# Altium schematic sheet 26_Radar_PMIC_and_rail_filters.SchDoc
size 289 x 400 mm
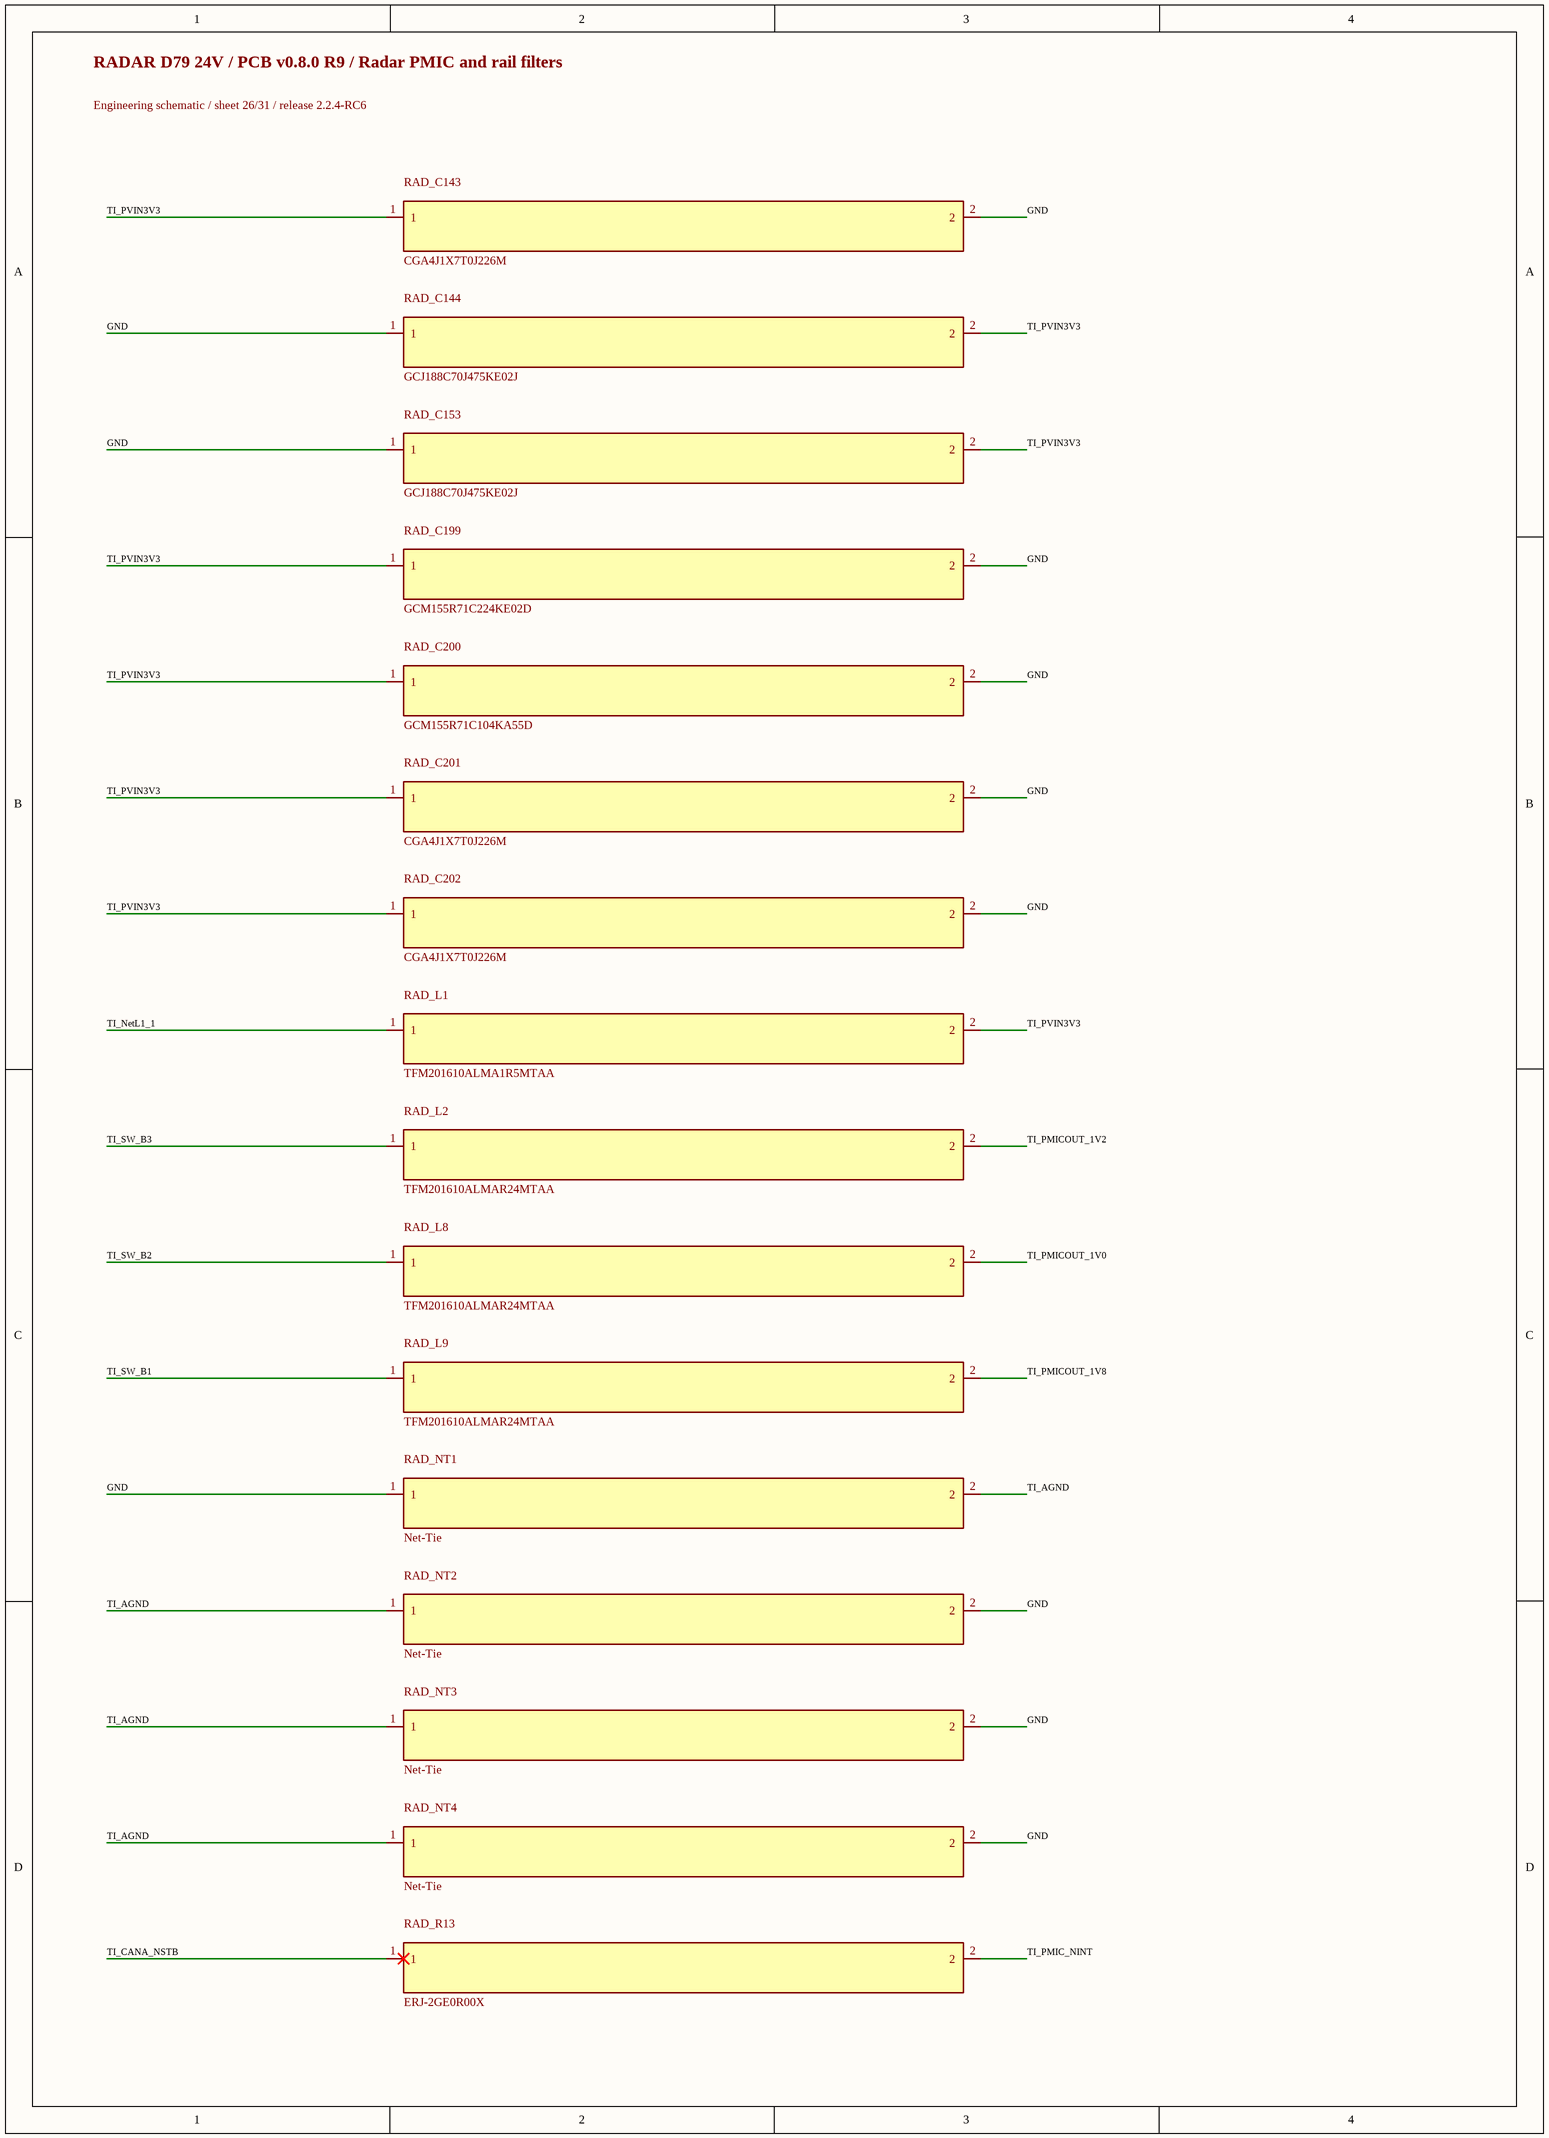
[diagram p0: 26_Radar_PMIC_and_rail_filters.SchDoc]

## Parts
RAD_C143  CGA4J1X7T0J226M  [0805_155]
RAD_C144  GCJ188C70J475KE02J  [FP-GCJ188C70J475KE02J_0603-MFG]
RAD_C153  GCJ188C70J475KE02J  [FP-GCJ188C70J475KE02J_0603-MFG]
RAD_C199  GCM155R71C224KE02D  [0402L]
RAD_C200  GCM155R71C104KA55D  [0402L]
RAD_C201  CGA4J1X7T0J226M  [0805_155]
RAD_C202  CGA4J1X7T0J226M  [0805_155]
RAD_L1  TFM201610ALMA1R5MTAA  [TFM201610ALMA]
RAD_L2  TFM201610ALMAR24MTAA  [FP-TFM201610ALMAR24MTAA_0806 (2016 Metric)-MFG]
RAD_L8  TFM201610ALMAR24MTAA  [FP-TFM201610ALMAR24MTAA_0806 (2016 Metric)-MFG]
RAD_L9  TFM201610ALMAR24MTAA  [FP-TFM201610ALMAR24MTAA_0806 (2016 Metric)-MFG]
RAD_NT1  Net-Tie  [Net-Tie_50milWide_30milLong]  (net tie, no BOM)
RAD_NT2  Net-Tie  [Net-Tie_50milWide_30milLong]  (net tie, no BOM)
RAD_NT3  Net-Tie  [Net-Tie_50milWide_30milLong]  (net tie, no BOM)
RAD_NT4  Net-Tie  [Net-Tie_50milWide_30milLong]  (net tie, no BOM)
RAD_R13  ERJ-2GE0R00X  [0402L]

## Nets
GND: RAD_C143.2 RAD_C144.1 RAD_C153.1 RAD_C199.2 RAD_C200.2 RAD_C201.2 RAD_C202.2 RAD_NT1.1 RAD_NT2.2 RAD_NT3.2 RAD_NT4.2
TI_AGND: RAD_NT1.2 RAD_NT2.1 RAD_NT3.1 RAD_NT4.1
TI_CANA_NSTB: RAD_R13.1
TI_NetL1_1: RAD_L1.1
TI_PMIC_NINT: RAD_R13.2
TI_PMICOUT_1V0: RAD_L8.2
TI_PMICOUT_1V2: RAD_L2.2
TI_PMICOUT_1V8: RAD_L9.2
TI_PVIN3V3: RAD_C143.1 RAD_C144.2 RAD_C153.2 RAD_C199.1 RAD_C200.1 RAD_C201.1 RAD_C202.1 RAD_L1.2
TI_SW_B1: RAD_L9.1
TI_SW_B2: RAD_L8.1
TI_SW_B3: RAD_L2.1

## Notes on the sheet
- RADAR D79 24V / PCB v0.8.0 R9 / Radar PMIC and rail filters
- Engineering schematic / sheet 26/31 / release 2.2.4-RC6